# Altium project project.PrjPcb
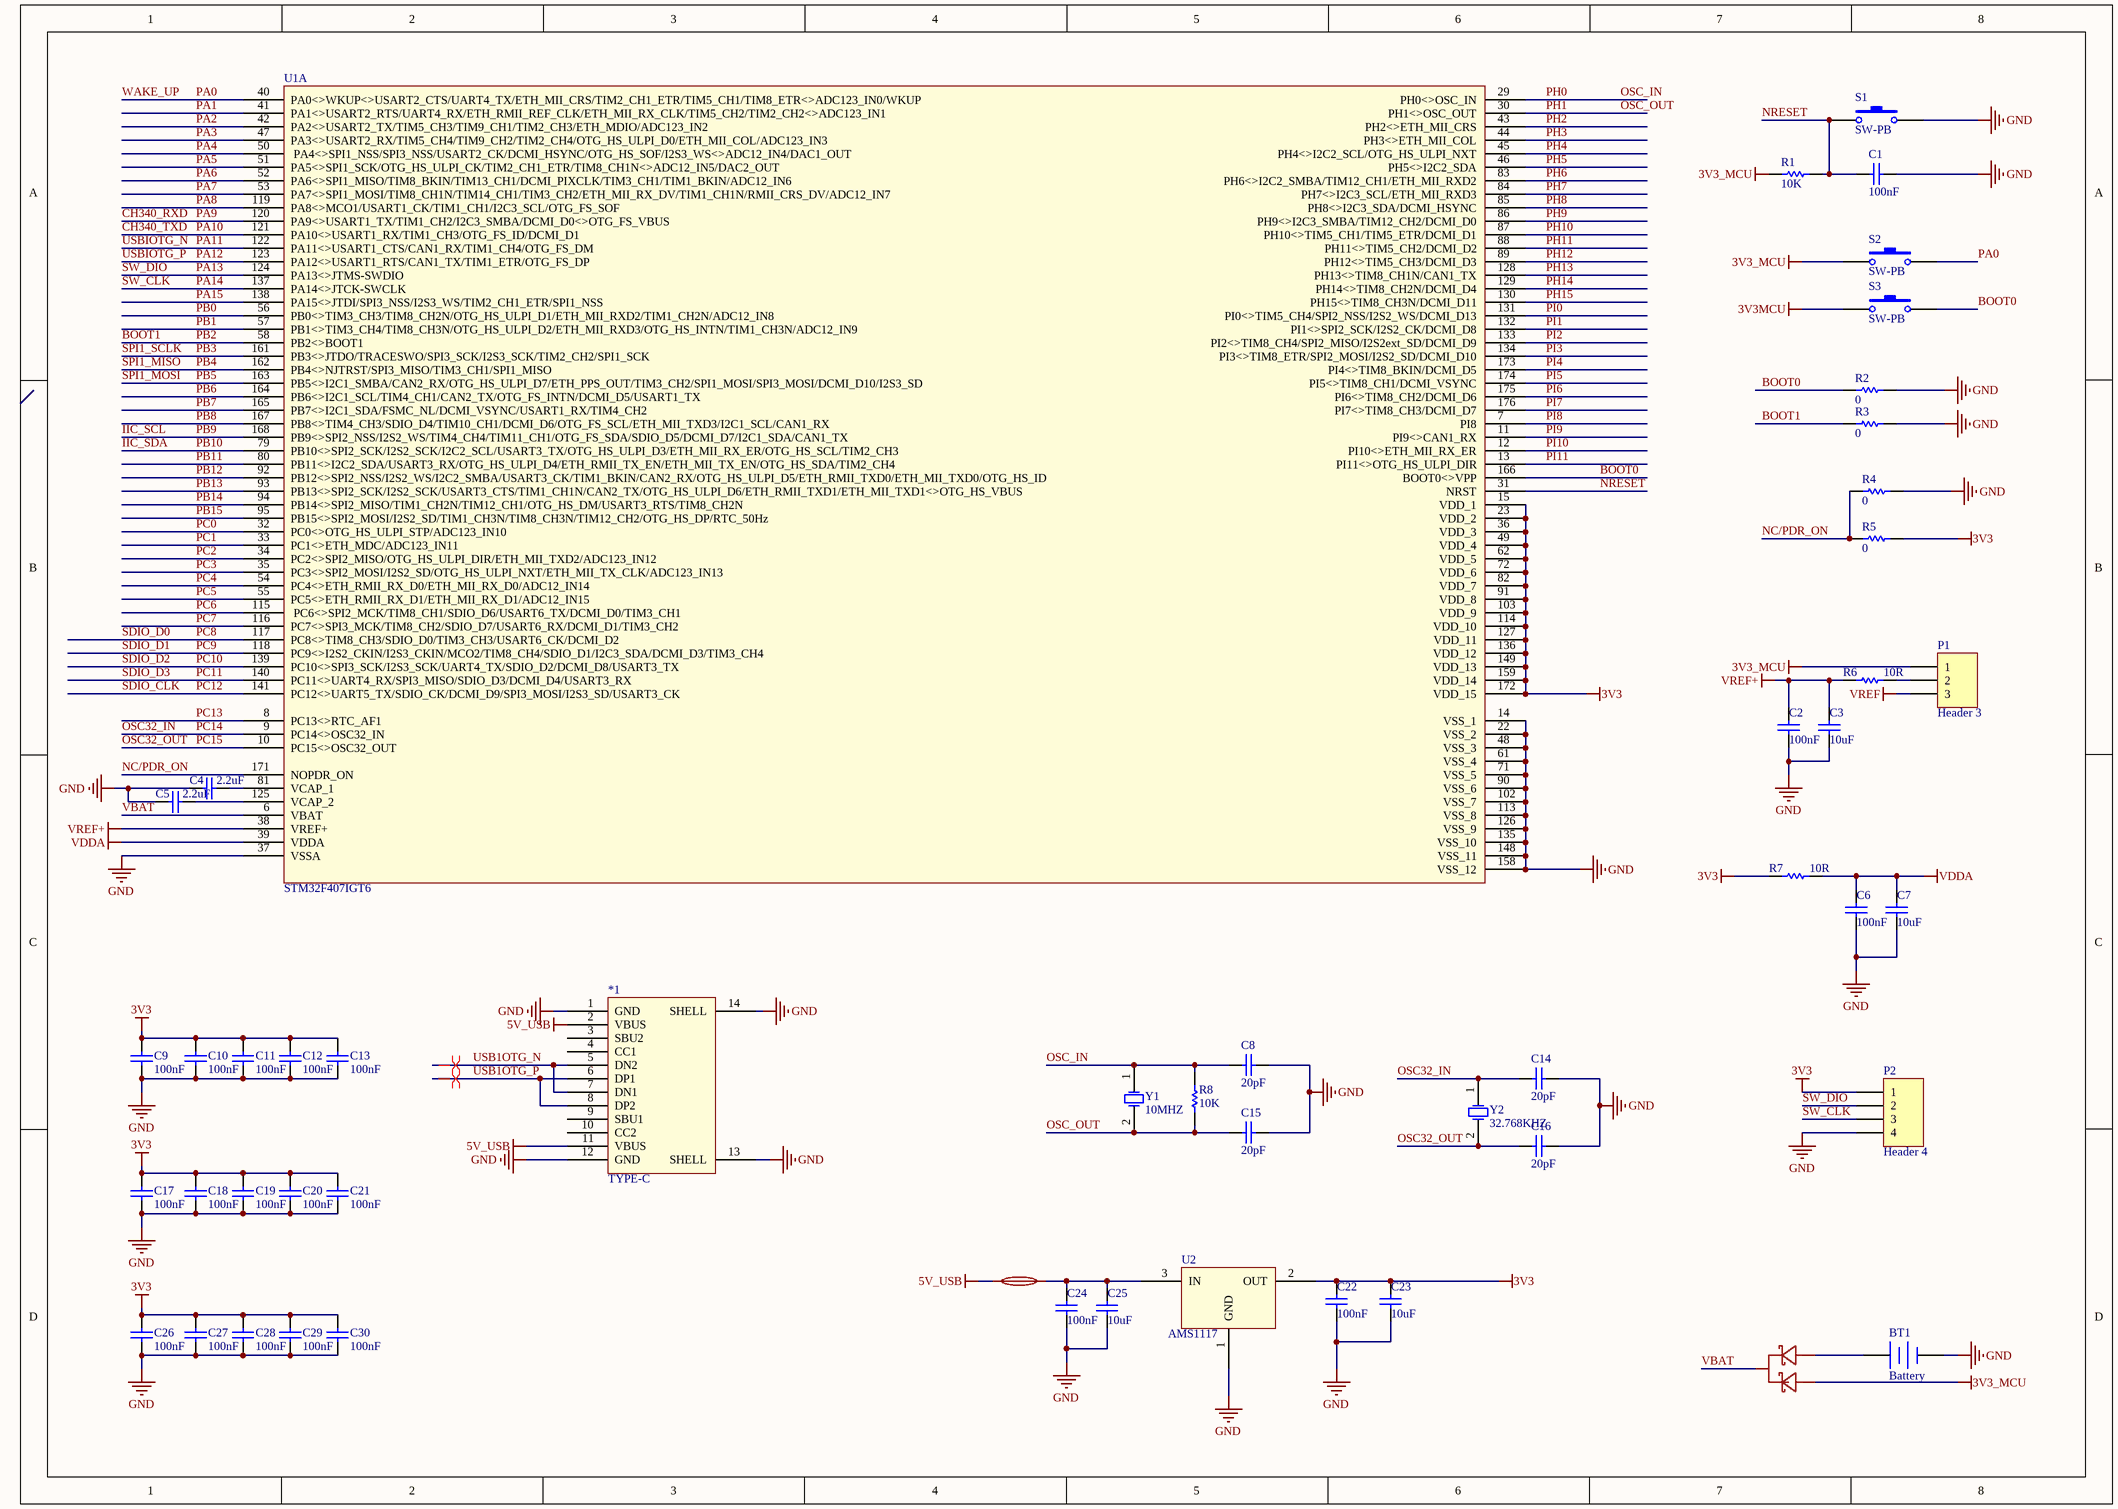
[diagram p0: Sheet2.SchDoc]
3 sheets, 96 parts. Net scope: global (net labels, ports and power ports of the same name join across sheets).
Board file: PCB1.PcbDoc
Sheets:
  Sheet2.SchDoc
  Sheet1.SchDoc
  Sheet3.SchDoc

## Sheet Sheet2.SchDoc
size A3; SheetNumber: 1; SheetTotal: 3

### Parts
*1  TYPE-C  [USB-C-SMD_TYPE-C-6PIN-2MD-073]
BT1  Battery  [BAT-SMD_CR1220-2]
C1  100nF  [C0603]
C2  100nF  [C0603]
C3  10uF  [C0603]
C4  2.2uF  [C0603]
C5  2.2uF  [C0603]
C6  100nF  [C0603]
C7  10uF  [C0603]
C8  20pF  [C0603]
C9  100nF  [C0603]
C10  100nF  [C0603]
C11  100nF  [C0603]
C12  100nF  [C0603]
C13  100nF  [C0603]
C14  20pF  [C0603]
C15  20pF  [C0603]
C16  20pF  [C0603]
C17  100nF  [C0603]
C18  100nF  [C0603]
C19  100nF  [C0603]
C20  100nF  [C0603]
C21  100nF  [C0603]
C22  100nF  [C0603]
C23  10uF  [C0603]
C24  100nF  [C0603]
C25  10uF  [C0603]
C26  100nF  [C0603]
C27  100nF  [C0603]
C28  100nF  [C0603]
C29  100nF  [C0603]
C30  100nF  [C0603]
F1  smd1206-100-30  [F1206]  (value not drawn)
P1  Header 3  [HDR1X3]
P2  Header 4  [CONN-SMD_HCZZ0021-4]
R1  10K  [R0603]
R2  0  [R0603]
R3  0  [R0603]
R4  0  [R0603]
R5  0  [R0603]
R6  10R  [R0603]
R7  10R  [R0603]
R8  10K  [R0603]
S1  SW-PB  [KEY-SMD_L6.2-W3.6-LS8.0]
S2  SW-PB  [KEY-SMD_L6.2-W3.6-LS8.0]
S3  SW-PB  [KEY-SMD_L6.2-W3.6-LS8.0]
U1  STM32F407IGT6  [LQFP-176_L24.0-W24.0-P0.50-BL]  (part A of 2)
U2  AMS1117  [SOT-89-3_L4.5-W2.5-P1.50-LS4.2-BR]
U3  bat54c_c22466350  [SOT-23-3_L2.9-W1.3-P1.90-LS2.4-BR]  (value not drawn)
Y1  10MHZ  [CRYSTAL-SMD_L5.0-W3.2]
Y2  32.768KHZ  [CRYSTAL-SMD_L5.0-W3.2]

### Nets
3V3: C9.1 C10.1 C11.1 C12.1 C13.1 C17.1 C18.1 C19.1 C20.1 C21.1 C22.1 C23.1 C26.1 C27.1 C28.1 C29.1 C30.1 P2.1 R5.1 R7.2 U1.15(VDD_1) U1.23(VDD_2) U1.36(VDD_3) U1.49(VDD_4) U1.62(VDD_5) U1.72(VDD_6) U1.82(VDD_7) U1.91(VDD_8) U1.103(VDD_9) U1.114(VDD_10) U1.127(VDD_11) U1.136(VDD_12) U1.149(VDD_13) U1.159(VDD_14) U1.172(VDD_15) U2.2(OUT)
3V3_MCU: P1.1 R1.2 S2.1 U3.1(A)
3V3MCU: S3.1
5V_USB: *1.2(VBUS) *1.11(VBUS) F1.1
GND: *1.1(GND) *1.12(GND) *1.13(SHELL) *1.14(SHELL) BT1.2(-) C1.2 C2.2 C3.2 C4.2 C5.1 C6.2 C7.2 C8.1 C9.2 C10.2 C11.2 C12.2 C13.2 C14.1 C15.1 C16.1 C17.2 C18.2 C19.2 C20.2 C21.2 C22.2 C23.2 C24.2 C25.2 C26.2 C27.2 C28.2 C29.2 C30.2 P2.4 R2.1 R3.1 R4.1 S1.2 U1.14(VSS_1) U1.22(VSS_2) U1.37(VSSA) U1.48(VSS_3) U1.61(VSS_4) U1.71(VSS_5) U1.90(VSS_6) U1.102(VSS_7) U1.113(VSS_8) U1.126(VSS_9) U1.135(VSS_10) U1.148(VSS_11) U1.158(VSS_12) U2.1(GND)
VDDA: C6.1 C7.1 R7.1 U1.39(VDDA)
VREF: P1.3
VREF+: C2.1 C3.1 R6.2 U1.38(VREF+)
BOOT0: R2.2 S3.2 U1.166(BOOT0<>VPP)
BOOT1: R3.2 U1.58(PB2<>BOOT1)  [also labelled PB2]
CH340_RXD: U1.120(PA9<>USART1_TX/TIM1_CH2/I2C3_SMBA/DCMI_D0<>OTG_FS_VBUS)  [also labelled PA9]
CH340_TXD: U1.121(PA10<>USART1_RX/TIM1_CH3/OTG_FS_ID/DCMI_D1)  [also labelled PA10]
IIC_SCL: U1.168(PB9<>SPI2_NSS/I2S2_WS/TIM4_CH4/TIM11_CH1/OTG_FS_SDA/SDIO_D5/DCMI_D7/I2C1_SDA/CAN1_TX)  [also labelled PB9]  [project net DCMI_SDA]
IIC_SDA: U1.79(PB10<>SPI2_SCK/I2S2_SCK/I2C2_SCL/USART3_TX/OTG_HS_ULPI_D3/ETH_MII_RX_ER/OTG_HS_SCL/TIM2_CH3)  [also labelled PB10]
NC/PDR_ON: R4.2 R5.2 U1.171(NOPDR_ON)
NRESET: C1.1 R1.1 S1.1 U1.31(NRST)
OSC32_IN: C14.2 U1.9(PC14<>OSC32_IN) Y2.1(OSC1)  [also labelled PC14]
OSC32_OUT: C16.2 U1.10(PC15<>OSC32_OUT) Y2.2(OSC2)  [also labelled PC15]
OSC_IN: C8.2 R8.1 U1.29(PH0<>OSC_IN) Y1.1(OSC1)  [also labelled PH0]
OSC_OUT: C15.2 R8.2 U1.30(PH1<>OSC_OUT) Y1.2(OSC2)  [also labelled PH1]
PA0: S2.2 U1.40(PA0<>WKUP<>USART2_CTS/UART4_TX/ETH_MII_CRS/TIM2_CH1_ETR/TIM5_CH1/TIM8_ETR<>ADC123_IN0/WKUP)  [also labelled WAKE_UP]
PA1: U1.41(PA1<>USART2_RTS/UART4_RX/ETH_RMII_REF_CLK/ETH_MII_RX_CLK/TIM5_CH2/TIM2_CH2<>ADC123_IN1)
PA2: U1.42(PA2<>USART2_TX/TIM5_CH3/TIM9_CH1/TIM2_CH3/ETH_MDIO/ADC123_IN2)
PA3: U1.47(PA3<>USART2_RX/TIM5_CH4/TIM9_CH2/TIM2_CH4/OTG_HS_ULPI_D0/ETH_MII_COL/ADC123_IN3)
PA4: U1.50(PA4<>SPI1_NSS/SPI3_NSS/USART2_CK/DCMI_HSYNC/OTG_HS_SOF/I2S3_WS<>ADC12_IN4/DAC1_OUT)  [project net DCMI_HREF]
PA5: U1.51(PA5<>SPI1_SCK/OTG_HS_ULPI_CK/TIM2_CH1_ETR/TIM8_CH1N<>ADC12_IN5/DAC2_OUT)
PA6: U1.52(PA6<>SPI1_MISO/TIM8_BKIN/TIM13_CH1/DCMI_PIXCLK/TIM3_CH1/TIM1_BKIN/ADC12_IN6)  [project net DCAM_PCLK]
PA7: U1.53(PA7<>SPI1_MOSI/TIM8_CH1N/TIM14_CH1/TIM3_CH2/ETH_MII_RX_DV/TIM1_CH1N/RMII_CRS_DV/ADC12_IN7)
PA8: U1.119(PA8<>MCO1/USART1_CK/TIM1_CH1/I2C3_SCL/OTG_FS_SOF)  [project net DCMI_XCLK]
PA11: U1.122(PA11<>USART1_CTS/CAN1_RX/TIM1_CH4/OTG_FS_DM)  [also labelled USBIOTG_N]
PA12: U1.123(PA12<>USART1_RTS/CAN1_TX/TIM1_ETR/OTG_FS_DP)  [also labelled USBIOTG_P]
PA13: P2.2 U1.124(PA13<>JTMS-SWDIO)  [also labelled SW_DIO]
PA14: P2.3 U1.137(PA14<>JTCK-SWCLK)  [also labelled SW_CLK]
PA15: U1.138(PA15<>JTDI/SPI3_NSS/I2S3_WS/TIM2_CH1_ETR/SPI1_NSS)
PB0: U1.56(PB0<>TIM3_CH3/TIM8_CH2N/OTG_HS_ULPI_D1/ETH_MII_RXD2/TIM1_CH2N/ADC12_IN8)
PB1: U1.57(PB1<>TIM3_CH4/TIM8_CH3N/OTG_HS_ULPI_D2/ETH_MII_RXD3/OTG_HS_INTN/TIM1_CH3N/ADC12_IN9)
PB3: U1.161(PB3<>JTDO/TRACESWO/SPI3_SCK/I2S3_SCK/TIM2_CH2/SPI1_SCK)  [also labelled SPI1_SCLK]
PB4: U1.162(PB4<>NJTRST/SPI3_MISO/TIM3_CH1/SPI1_MISO)  [also labelled SPI1_MISO]
PB5: U1.163(PB5<>I2C1_SMBA/CAN2_RX/OTG_HS_ULPI_D7/ETH_PPS_OUT/TIM3_CH2/SPI1_MOSI/SPI3_MOSI/DCMI_D10/I2S3_SD)  [also labelled SPI1_MOSI]  [project net DCMI_D5]
PB6: U1.164(PB6<>I2C1_SCL/TIM4_CH1/CAN2_TX/OTG_FS_INTN/DCMI_D5/USART1_TX)
PB7: U1.165(PB7<>I2C1_SDA/FSMC_NL/DCMI_VSYNC/USART1_RX/TIM4_CH2)  [project net DCAI_VSYNC]
PB8: U1.167(PB8<>TIM4_CH3/SDIO_D4/TIM10_CH1/DCMI_D6/OTG_FS_SCL/ETH_MII_TXD3/I2C1_SCL/CAN1_RX)  [project net DCMI_SCL]
PB11: U1.80(PB11<>I2C2_SDA/USART3_RX/OTG_HS_ULPI_D4/ETH_RMII_TX_EN/ETH_MII_TX_EN/OTG_HS_SDA/TIM2_CH4)
PB12: U1.92(PB12<>SPI2_NSS/I2S2_WS/I2C2_SMBA/USART3_CK/TIM1_BKIN/CAN2_RX/OTG_HS_ULPI_D5/ETH_RMII_TXD0/ETH_MII_TXD0/OTG_HS_ID)
PB13: U1.93(PB13<>SPI2_SCK/I2S2_SCK/USART3_CTS/TIM1_CH1N/CAN2_TX/OTG_HS_ULPI_D6/ETH_RMII_TXD1/ETH_MII_TXD1<>OTG_HS_VBUS)
PB14: U1.94(PB14<>SPI2_MISO/TIM1_CH2N/TIM12_CH1/OTG_HS_DM/USART3_RTS/TIM8_CH2N)
PB15: U1.95(PB15<>SPI2_MOSI/I2S2_SD/TIM1_CH3N/TIM8_CH3N/TIM12_CH2/OTG_HS_DP/RTC_50Hz)
PC0: U1.32(PC0<>OTG_HS_ULPI_STP/ADC123_IN10)  [project net DCMI_PWDN]
PC1: U1.33(PC1<>ETH_MDC/ADC123_IN11)
PC2: U1.34(PC2<>SPI2_MISO/OTG_HS_ULPI_DIR/ETH_MII_TXD2/ADC123_IN12)
PC3: U1.35(PC3<>SPI2_MOSI/I2S2_SD/OTG_HS_ULPI_NXT/ETH_MII_TX_CLK/ADC123_IN13)
PC4: U1.54(PC4<>ETH_RMII_RX_D0/ETH_MII_RX_D0/ADC12_IN14)
PC5: U1.55(PC5<>ETH_RMII_RX_D1/ETH_MII_RX_D1/ADC12_IN15)
PC6: U1.115(PC6<>SPI2_MCK/TIM8_CH1/SDIO_D6/USART6_TX/DCMI_D0/TIM3_CH1)  [project net DCMI_D0]
PC7: U1.116(PC7<>SPI3_MCK/TIM8_CH2/SDIO_D7/USART6_RX/DCMI_D1/TIM3_CH2)  [project net DCMI_D1]
PC8: U1.117(PC8<>TIM8_CH3/SDIO_D0/TIM3_CH3/USART6_CK/DCMI_D2)  [also labelled SDIO_D0]  [project net DCMI_D2]
PC9: U1.118(PC9<>I2S2_CKIN/I2S3_CKIN/MCO2/TIM8_CH4/SDIO_D1/I2C3_SDA/DCMI_D3/TIM3_CH4)  [also labelled SDIO_D1]  [project net DCMI_D3]
PC10: U1.139(PC10<>SPI3_SCK/I2S3_SCK/UART4_TX/SDIO_D2/DCMI_D8/USART3_TX)  [also labelled SDIO_D2]
PC11: U1.140(PC11<>UART4_RX/SPI3_MISO/SDIO_D3/DCMI_D4/USART3_RX)  [also labelled SDIO_D3]
PC12: U1.141(PC12<>UART5_TX/SDIO_CK/DCMI_D9/SPI3_MOSI/I2S3_SD/USART3_CK)  [also labelled SDIO_CLK]
PC13: U1.8(PC13<>RTC_AF1)
PH2: U1.43(PH2<>ETH_MII_CRS)
PH3: U1.44(PH3<>ETH_MII_COL)
PH4: U1.45(PH4<>I2C2_SCL/OTG_HS_ULPI_NXT)
PH5: U1.46(PH5<>I2C2_SDA)
PH6: U1.83(PH6<>I2C2_SMBA/TIM12_CH1/ETH_MII_RXD2)
PH7: U1.84(PH7<>I2C3_SCL/ETH_MII_RXD3)
PH8: U1.85(PH8<>I2C3_SDA/DCMI_HSYNC)
PH9: U1.86(PH9<>I2C3_SMBA/TIM12_CH2/DCMI_D0)
PH10: U1.87(PH10<>TIM5_CH1/TIM5_ETR/DCMI_D1)
PH11: U1.88(PH11<>TIM5_CH2/DCMI_D2)
PH12: U1.89(PH12<>TIM5_CH3/DCMI_D3)
PH13: U1.128(PH13<>TIM8_CH1N/CAN1_TX)
PH14: U1.129(PH14<>TIM8_CH2N/DCMI_D4)
PH15: U1.130(PH15<>TIM8_CH3N/DCMI_D11)
PI0: U1.131(PI0<>TIM5_CH4/SPI2_NSS/I2S2_WS/DCMI_D13)
PI1: U1.132(PI1<>SPI2_SCK/I2S2_CK/DCMI_D8)
PI2: U1.133(PI2<>TIM8_CH4/SPI2_MISO/I2S2ext_SD/DCMI_D9)
PI3: U1.134(PI3<>TIM8_ETR/SPI2_MOSI/I2S2_SD/DCMI_D10)
PI4: U1.173(PI4<>TIM8_BKIN/DCMI_D5)
PI5: U1.174(PI5<>TIM8_CH1/DCMI_VSYNC)
PI6: U1.175(PI6<>TIM8_CH2/DCMI_D6)
PI7: U1.176(PI7<>TIM8_CH3/DCMI_D7)
PI8: U1.7(PI8)
PI9: U1.11(PI9<>CAN1_RX)
PI10: U1.12(PI10<>ETH_MII_RX_ER)
PI11: U1.13(PI11<>OTG_HS_ULPI_DIR)
USB1OTG_N: *1.5(DN2) *1.7(DN1)
USB1OTG_P: *1.6(DP1) *1.8(DP2)
VBAT: U1.6(VBAT) U3.3(K)
NetBT1_1: BT1.1(+) U3.2(A)
NetC4_1: C4.1 U1.81(VCAP_1)
NetC5_2: C5.2 U1.125(VCAP_2)
NetC24_1: C24.1 C25.1 F1.2 U2.3(IN)
NetP1_2: P1.2 R6.1

Not connected (* = marked no-connect by the designer): *1 3(SBU2) 4(CC1) 9(SBU1) 10(CC2)

### Layout directives
differential pair: USB1OTG_N, USB1OTG_P

### Library data of the parts
BT1 = Battery: Multicell Battery; Published: 24-Mar-1999; LatestRevisionDate: 17-Jul-2002; LatestRevisionNote: Re-released for DXP Platform.; PackageReference: BAT-2; Publisher: Altium Limited; PackageDescription: Battery; 2 Leads
C1-C30 = Cap: Capacitor; Value: 100pF; Published: 8-Jun-2000; LatestRevisionDate: 17-Jul-2002; LatestRevisionNote: Re-released for DXP Platform.; PackageReference: RAD-0.3; Publisher: Altium Limited; PackageDescription: Radial Cap, Thru-Hole; 2 Leads; 0.3 in Pin Spacing
F1 = smd1206-100-30: 耐压(Vmax):30V;最大电流(Imax):40A;保持电流(Ihold):1A;跳闸电流(Itrip):1.8A;; Manufacturer: R+O(宏嘉诚); AddInBom: yes; ModelId: f1628daad26847a79b887277a2bc8541; ModelName: F1206_L3.2-W1.7-H0.6; ModelTransform: 125.984,66.929,0,0,0,0,0,0,0; Voltage - Max: 30V; Current - Max: 40A; Hold Current: 1A; Trip Current: 1.8A; Power Dissipation: 1W; Resistance - Initial (Ri) (Min): 50mΩ; Resistance - Post Trip (R1) (Max): 300mΩ; Time to Trip(Max): 300ms; Symbol: SMD1206-100-30; LCSC Part Name: 30V 1A; SupplierPart: C46641026; ManufacturerPart: SMD1206-100-30; Supplier Footprint: 1206; JLCPCB Part Class: Extended Part; Datasheet: https://item.szlcsc.com/datasheet/SMD1206-100-30/48798732.html; Supplier: LCSC; ConvertToPcb: yes; FootprintName: F1206; Operating Temperature: -40℃~+85℃; Length: 3.6mm; Width: 1.9mm; Height: 1.3mm
P1 = Header 3: Header, 3-Pin; LatestRevisionDate: 17-Jul-2002; LatestRevisionNote: Re-released for DXP Platform.; Publisher: Altium Limited
P2 = Header 4: Header, 4-Pin; LatestRevisionDate: 17-Jul-2002; LatestRevisionNote: Re-released for DXP Platform.; Publisher: Altium Limited
R1-R8 = Res1: Resistor; Value: 1K; Published: 8-Jun-2000; LatestRevisionDate: 17-Jul-2002; LatestRevisionNote: Re-released for DXP Platform.; PackageReference: AXIAL-0.3; Publisher: Altium Limited; PackageDescription: Axial Device, Thru-Hole; 2 Leads; 0.3 in Pin Spacing
S1-S3 = SW-PB: Switch; Published: 24-Mar-1999; LatestRevisionDate: 17-Jul-2002; LatestRevisionNote: Re-released for DXP Platform.; PackageReference: SPST-2; Publisher: Altium Limited; PackageDescription: Switch; 2 Leads
U1 = STM32F407IGT6: mcu
U3 = bat54c_c22466350: 二极管配置:1对共阴极;正向压降(Vf):1V@100mA;直流反向耐压(Vr):30V;整流电流:200mA;; Manufacturer: R+O(宏嘉诚); ManufacturerPart: BAT54C; AddInBom: yes; ModelId: 4be4999f02b344ffbcd0d3b39a4b0072; ModelName: SOT-23-3_L2.9-W1.3-P1.90-LS2.8-BR; ModelTransform: 110.236,114.173,0,0,0,0,0,0,0; Diode Configuration: 1对共阴极; Voltage - DC Reverse(Vr): 30V; Current - Rectified: 200mA; Reverse Leakage Current (Ir): 2uA@25V; Non-Repetitive Peak Forward Surge Current: 600mA; Symbol: BAT54C_C22466350; LCSC Part Name: 电压:30V 电流:0.2A; SupplierPart: C22466350; Supplier Footprint: SOT-23; JLCPCB Part Class: Extended Part; Datasheet: https://item.szlcsc.com/datasheet/BAT54C/24165509.html; Supplier: LCSC; ConvertToPcb: yes; FootprintName: SOT-23-3_L2.9-W1.3-P1.90-LS2.8-BR; Voltage - Forward(Vf@If): 1V@100mA; Operating Junction Temperature Range: -
Y1 Y2 = XTAL: Crystal Oscillator; Published: 8-Jun-2000; LatestRevisionDate: 17-Jul-2002; LatestRevisionNote: Re-released for DXP Platform.; PackageReference: R38; Publisher: Altium Limited; PackageDescription: Crystal, Thru-Hole; 2 Leads; Body 3.1 x 8.2 mm (Dia.xH)

## Sheet Sheet1.SchDoc
size A3; SheetNumber: 2; SheetTotal: 3
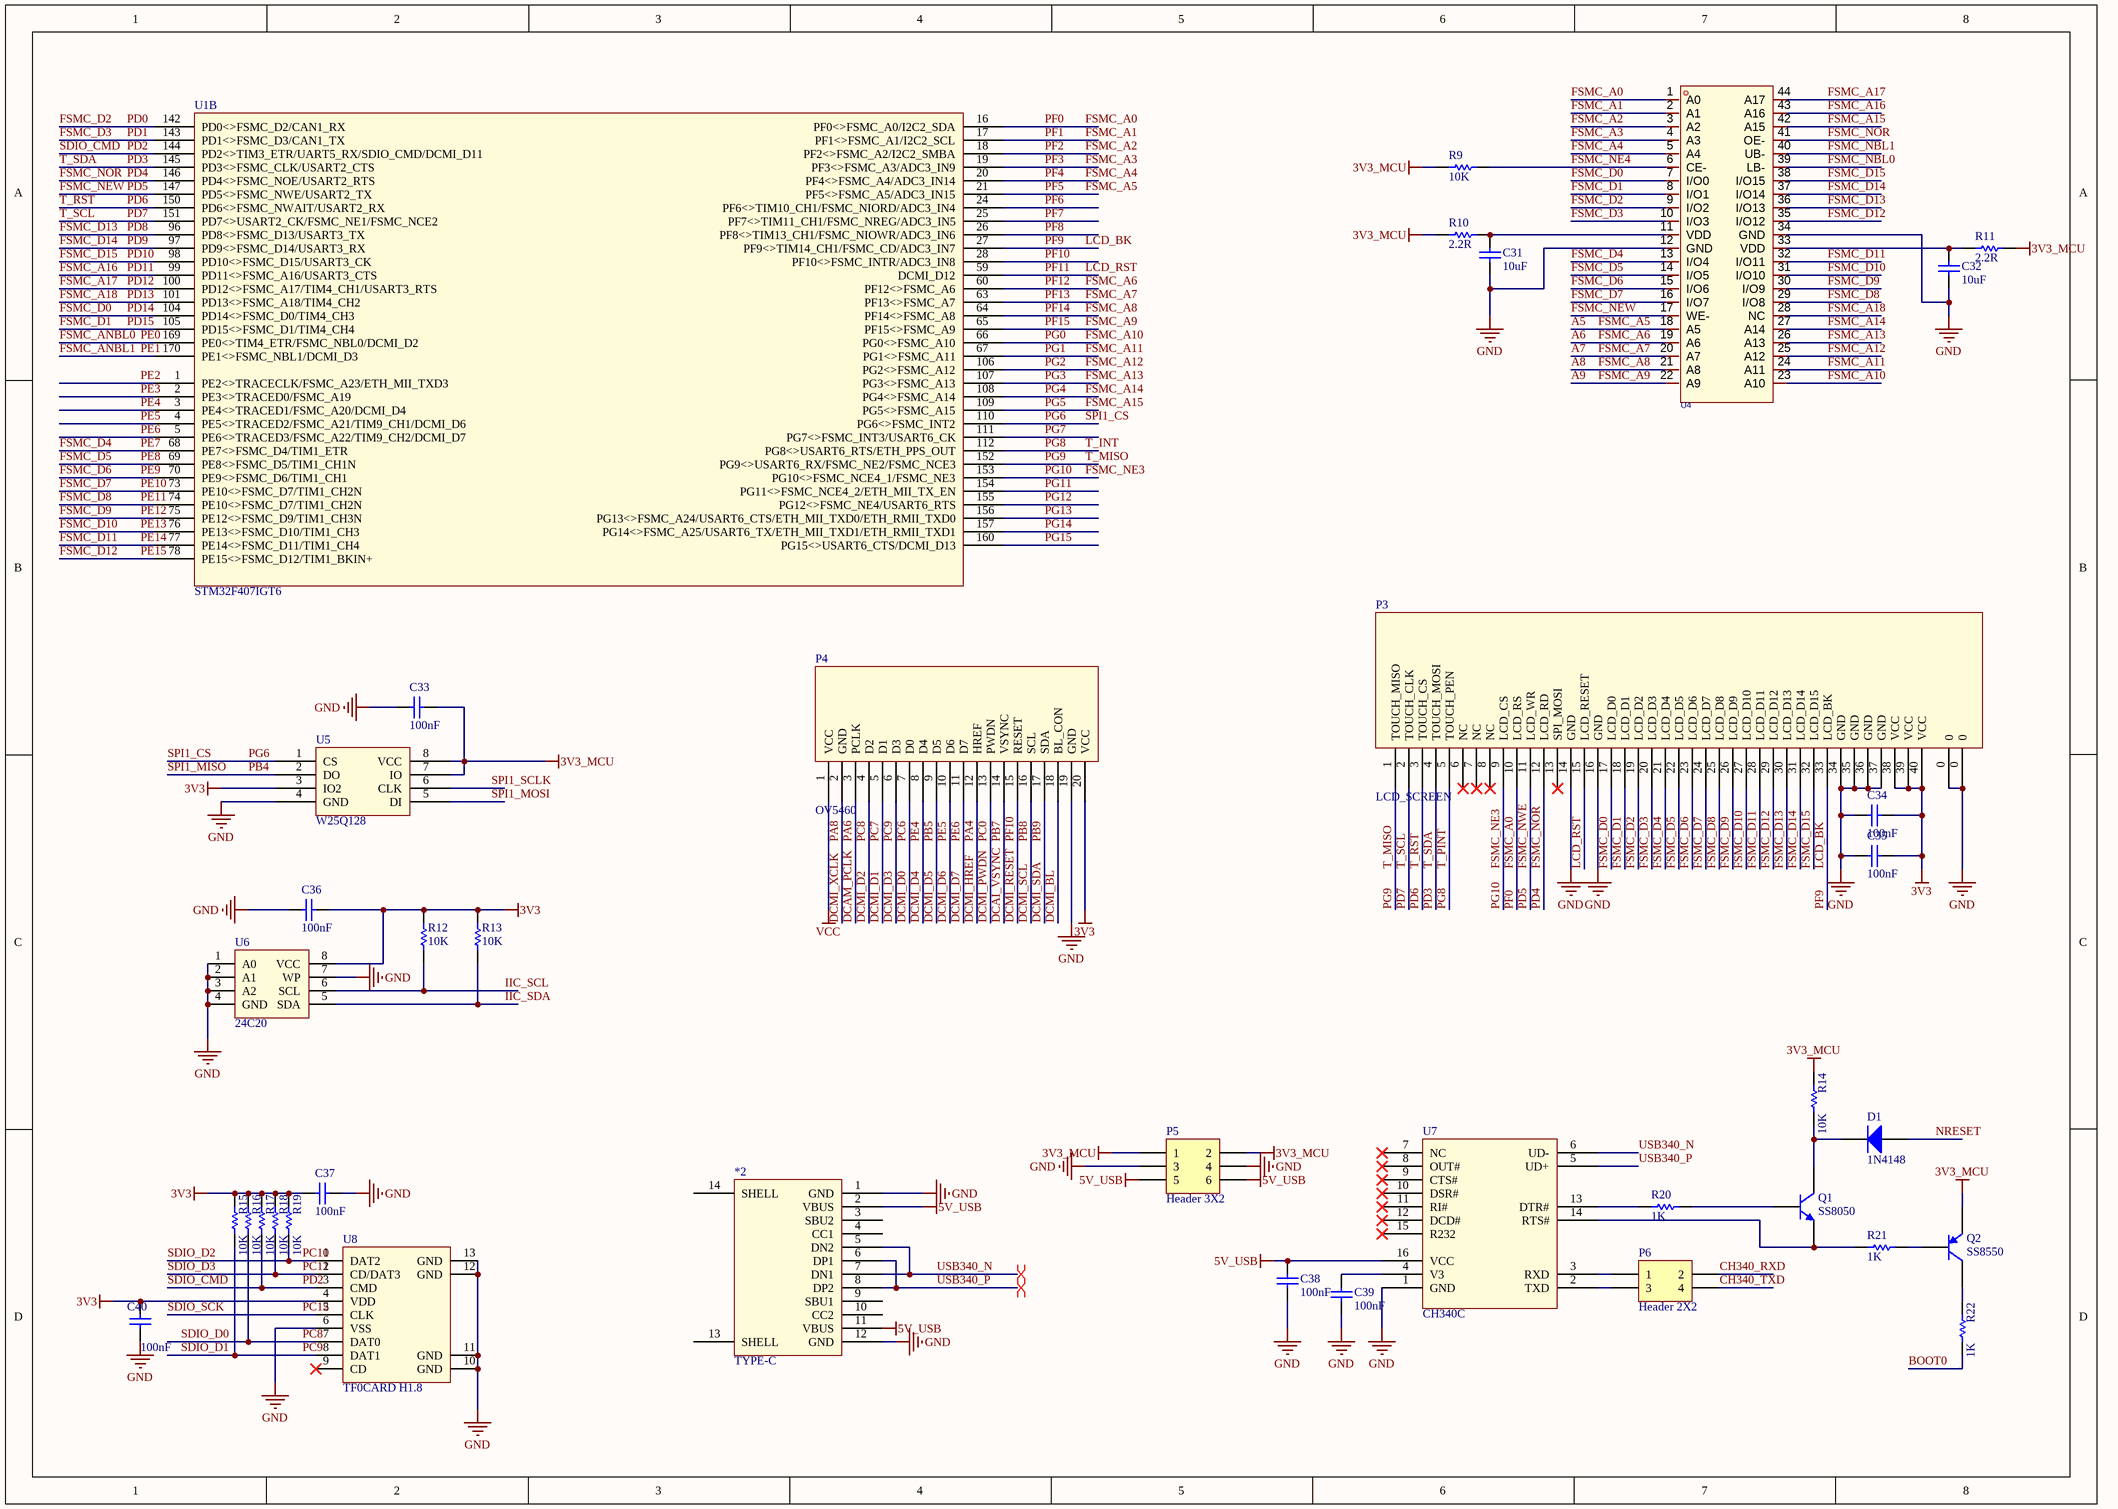
[diagram p1: Sheet1.SchDoc]

### Parts
*2  TYPE-C  [USB-C-SMD_TYPE-C-6PIN-2MD-073]
C31  10uF  [C0603]
C32  10uF  [C0603]
C33  100nF  [C0603]
C34  100nF  [C0603]
C35  100nF  [C0603]
C36  100nF  [C0603]
C37  100nF  [C0603]
C38  100nF  [C0603]
C39  100nF  [C0603]
C40  100nF  [C0603]
D1  1N4148  [SOD-123_L2.7-W1.6-LS3.7-FD]
P3  LCD_SCREEN  [FPC-SMD_P0.50-40P_FGS-XJ-H2.0]
P4  OV5460  [FPC-SMD_20P-P0.50_XUNPU_FPC-05F-20PH20]
P5  Header 3X2  [HDR2X3]
P6  Header 2X2  [HDR2X2]
Q1  SS8050  [SOT-23-3_L2.9-W1.3-P1.90-LS2.4-BR]
Q2  SS8550  [SOT-23-3_L2.9-W1.3-P1.90-LS2.4-BR]
R9  10K  [R0603]
R10  2.2R  [R0603]
R11  2.2R  [R0603]
R12  10K  [R0603]
R13  10K  [R0603]
R14  10K  [R0603]
R15  10K  [R0603]
R16  10K  [R0603]
R17  10K  [R0603]
R18  10K  [R0603]
R19  10K  [R0603]
R20  1K  [R0603]
R21  1K  [R0603]
R22  1K  [R0603]
U1  STM32F407IGT6  [LQFP-176_L24.0-W24.0-P0.50-BL]  (part B of 2)
U4  is61lv25616al-10tli-tr  [TSOP-44_L18.4-W10.2-P0.80-LS11.8-BL]  (value not drawn)
U5  W25Q128  [SOIC-8_L5.3-W5.3-P1.27-LS8.0-BL]
U6  24C20  [SOP-8_L5.0-W4.0-P1.27-LS6.0-BL]
U7  CH340C  [SOP-16_L10.0-W3.9-P1.27-LS6.0-BL]
U8  TF0CARD H1.8  [TF-SMD_TF-PUSH]

### Nets
3V3: C34.2 C35.2 C36.1 C37.2 C40.1 P3.38(VCC) P3.39(VCC) P3.40(VCC) P4.20(VCC) R12.2 R13.2 R15.2 R16.2 R17.2 R18.2 R19.2 U5.3(IO2) U6.8(VCC) U8.4(VDD)
3V3_MCU: C33.1 P5.1 P5.2 Q2.3(E) R9.1 R10.1 R11.2 R14.2 U5.7(IO) U5.8(VCC)
5V_USB: *2.2(VBUS) *2.11(VBUS) C38.2 P5.5 P5.6 U7.16(VCC)
GND: *2.1(GND) *2.12(GND) C31.1 C32.1 C33.2 C34.1 C35.1 C36.2 C37.1 C38.1 C39.1 C40.2 P3.0 P3.14(GND) P3.16(GND) P3.34(GND) P3.35(GND) P3.36(GND) P3.37(GND) P4.19(GND) P5.3 P5.4 U4.12(GND) U4.34(GND) U5.4(GND) U6.1(A0) U6.2(A1) U6.3(A2) U6.4(GND) U6.7(WP) U7.1(GND) U8.6(VSS) U8.10(GND) U8.11(GND) U8.12(GND) U8.13(GND)
VCC: P4.1(VCC)
A5: U1.21(PF5<>FSMC_A5/ADC3_IN15) U4.18(A5)  [also labelled FSMC_A5, PF5]
A6: U1.60(PF12<>FSMC_A6) U4.19(A6)  [also labelled FSMC_A6, PF12]
A7: U1.63(PF13<>FSMC_A7) U4.20(A7)  [also labelled FSMC_A7, PF13]
A8: U1.64(PF14<>FSMC_A8) U4.21(A8)  [also labelled FSMC_A8, PF14]
A9: U1.65(PF15<>FSMC_A9) U4.22(A9)  [also labelled FSMC_A9, PF15]
BOOT0: R22.1
CH340_RXD: P6.2
CH340_TXD: P6.4
DCAI_VSYNC: P4.14(VSYNC)  [also labelled PB7]
DCAM_PCLK: P4.3(PCLK)  [also labelled PA6]
DCMI_BL: P4.18(BL_CON)
DCMI_D0: P4.7(D0)  [also labelled PC6]
DCMI_D1: P4.5(D1)  [also labelled PC7]
DCMI_D2: P4.4(D2) R16.1 U8.7(DAT0)  [also labelled PC8, SDIO_D0]
DCMI_D3: P4.6(D3) R15.1 U8.8(DAT1)  [also labelled PC9, SDIO_D1]
DCMI_D4: P4.8(D4) U1.3(PE4<>TRACED1/FSMC_A20/DCMI_D4)  [also labelled PE4]
DCMI_D5: P4.9(D5) U5.5(DI)  [also labelled PB5, SPI1_MOSI]
DCMI_D6: P4.10(D6) U1.4(PE5<>TRACED2/FSMC_A21/TIM9_CH1/DCMI_D6)  [also labelled PE5]
DCMI_D7: P4.11(D7) U1.5(PE6<>TRACED3/FSMC_A22/TIM9_CH2/DCMI_D7)  [also labelled PE6]
DCMI_HREF: P4.12(HREF)  [also labelled PA4]
DCMI_PWDN: P4.13(PWDN)  [also labelled PC0]
DCMI_RESET: P4.15(RESET) U1.28(PF10<>FSMC_INTR/ADC3_IN8)  [also labelled PF10]
DCMI_SCL: P4.16(SCL)  [also labelled PB8]
DCMI_SDA: P4.17(SDA) R12.1 U6.6(SCL)  [also labelled IIC_SCL, PB9]
DCMI_XCLK: P4.2(GND)  [also labelled PA8]
FSMC_A0: P3.10(LCD_RS) U1.16(PF0<>FSMC_A0/I2C2_SDA) U4.1(A0)  [also labelled PF0]
FSMC_A1: U1.17(PF1<>FSMC_A1/I2C2_SCL) U4.2(A1)  [also labelled PF1]
FSMC_A2: U1.18(PF2<>FSMC_A2/I2C2_SMBA) U4.3(A2)  [also labelled PF2]
FSMC_A3: U1.19(PF3<>FSMC_A3/ADC3_IN9) U4.4(A3)  [also labelled PF3]
FSMC_A4: U1.20(PF4<>FSMC_A4/ADC3_IN14) U4.5(A4)  [also labelled PF4]
FSMC_A10: U1.66(PG0<>FSMC_A10) U4.23(A10)  [also labelled PG0]
FSMC_A11: U1.67(PG1<>FSMC_A11) U4.24(A11)  [also labelled PG1]
FSMC_A12: U1.106(PG2<>FSMC_A12) U4.25(A12)  [also labelled PG2]
FSMC_A13: U1.107(PG3<>FSMC_A13) U4.26(A13)  [also labelled PG3]
FSMC_A14: U1.108(PG4<>FSMC_A14) U4.27(A14)  [also labelled PG4]
FSMC_A15: U1.109(PG5<>FSMC_A15) U4.42(A15)  [also labelled PG5]
FSMC_A16: U1.99(PD11<>FSMC_A16/USART3_CTS) U4.43(A16)  [also labelled PD11]
FSMC_A17: U1.100(PD12<>FSMC_A17/TIM4_CH1/USART3_RTS) U4.44(A17)  [also labelled PD12]
FSMC_A18: U1.101(PD13<>FSMC_A18/TIM4_CH2) U4.28(NC)  [also labelled PD13]
FSMC_ANBL0: U1.169(PE0<>TIM4_ETR/FSMC_NBL0/DCMI_D2)  [also labelled PE0]
FSMC_ANBL1: U1.170(PE1<>FSMC_NBL1/DCMI_D3)  [also labelled PE1]
FSMC_D0: P3.17(LCD_D0) U1.104(PD14<>FSMC_D0/TIM4_CH3) U4.7(I/O0)  [also labelled PD14]
FSMC_D1: P3.18(LCD_D1) U1.105(PD15<>FSMC_D1/TIM4_CH4) U4.8(I/O1)  [also labelled PD15]
FSMC_D2: P3.19(LCD_D2) U1.142(PD0<>FSMC_D2/CAN1_RX) U4.9(I/O2)  [also labelled PD0]
FSMC_D3: P3.20(LCD_D3) U1.143(PD1<>FSMC_D3/CAN1_TX) U4.10(I/O3)  [also labelled PD1]
FSMC_D4: P3.21(LCD_D4) U1.68(PE7<>FSMC_D4/TIM1_ETR) U4.13(I/O4)  [also labelled PE7]
FSMC_D5: P3.22(LCD_D5) U1.69(PE8<>FSMC_D5/TIM1_CH1N) U4.14(I/O5)  [also labelled PE8]
FSMC_D6: P3.23(LCD_D6) U1.70(PE9<>FSMC_D6/TIM1_CH1) U4.15(I/O6)  [also labelled PE9]
FSMC_D7: P3.24(LCD_D7) U1.73(PE10<>FSMC_D7/TIM1_CH2N) U4.16(I/O7)  [also labelled PE10]
FSMC_D8: P3.25(LCD_D8) U1.74(PE10<>FSMC_D7/TIM1_CH2N) U4.29(I/O8)  [also labelled PE11]
FSMC_D9: P3.26(LCD_D9) U1.75(PE12<>FSMC_D9/TIM1_CH3N) U4.30(I/O9)  [also labelled PE12]
FSMC_D10: P3.27(LCD_D10) U1.76(PE13<>FSMC_D10/TIM1_CH3) U4.31(I/O10)  [also labelled PE13]
FSMC_D11: P3.28(LCD_D11) U1.77(PE14<>FSMC_D11/TIM1_CH4) U4.32(I/O11)  [also labelled PE14]
FSMC_D12: P3.29(LCD_D12) U1.78(PE15<>FSMC_D12/TIM1_BKIN+) U4.35(I/O12)  [also labelled PE15]
FSMC_D13: P3.30(LCD_D13) U1.96(PD8<>FSMC_D13/USART3_TX) U4.36(I/O13)  [also labelled PD8]
FSMC_D14: P3.31(LCD_D14) U1.97(PD9<>FSMC_D14/USART3_RX) U4.37(I/O14)  [also labelled PD9]
FSMC_D15: P3.32(LCD_D15) U1.98(PD10<>FSMC_D15/USART3_CK) U4.38(I/O15)  [also labelled PD10]
FSMC_NBL0: U4.39(LB-)
FSMC_NBL1: U4.40(UB-)
FSMC_NE3: P3.9(LCD_CS) U1.153(PG10<>FSMC_NCE4_1/FSMC_NE3)  [also labelled PG10]
FSMC_NE4: R9.2 U4.6(CE-)
FSMC_NEW: P3.11(LCD_WR) U1.147(PD5<>FSMC_NWE/USART2_TX) U4.17(WE-)  [also labelled FSMC_NWE, PD5]
FSMC_NOR: P3.12(LCD_RD) U1.146(PD4<>FSMC_NOE/USART2_RTS) U4.41(OE-)  [also labelled PD4]
IIC_SDA: R13.1 U6.5(SDA)
LCD_BK: P3.33(LCD_BK) U1.27(PF9<>TIM14_CH1/FSMC_CD/ADC3_IN7)  [also labelled PF9]
LCD_RST: P3.15(LCD_RESET) U1.59(DCMI_D12)  [also labelled PF11]
NRESET: D1.1(A)
PB4: U5.2(DO)  [also labelled SPI1_MISO]
PC10: R19.1 U8.1(DAT2)  [also labelled SDIO_D2]
PC11: R18.1 U8.2(CD/DAT3)  [also labelled SDIO_D3]
PC12: U8.5(CLK)  [also labelled SDIO_SCK]
PD2: R17.1 U1.144(PD2<>TIM3_ETR/UART5_RX/SDIO_CMD/DCMI_D11) U8.3(CMD)  [also labelled SDIO_CMD]
PD3: P3.4(TOUCH_MOSI) U1.145(PD3<>FSMC_CLK/USART2_CTS)  [also labelled T_SDA, T_SD~{A}]
PD6: P3.3(TOUCH_CS) U1.150(PD6<>FSMC_NWAIT/USART2_RX)  [also labelled T_RST]
PD7: P3.2(TOUCH_CLK) U1.151(PD7<>USART2_CK/FSMC_NE1/FSMC_NCE2)  [also labelled T_SCL]
PE2: U1.1(PE2<>TRACECLK/FSMC_A23/ETH_MII_TXD3)
PE3: U1.2(PE3<>TRACED0/FSMC_A19)
PF6: U1.24(PF6<>TIM10_CH1/FSMC_NIORD/ADC3_IN4)
PF7: U1.25(PF7<>TIM11_CH1/FSMC_NREG/ADC3_IN5)
PF8: U1.26(PF8<>TIM13_CH1/FSMC_NIOWR/ADC3_IN6)
PG6: U1.110(PG6<>FSMC_INT2) U5.1(CS)  [also labelled SPI1_CS]
PG7: U1.111(PG7<>FSMC_INT3/USART6_CK)
PG8: P3.5(TOUCH_PEN) U1.112(PG8<>USART6_RTS/ETH_PPS_OUT)  [also labelled T_INT, T_PINT]
PG9: P3.1(TOUCH_MISO) U1.152(PG9<>USART6_RX/FSMC_NE2/FSMC_NCE3)  [also labelled T_MISO]
PG11: U1.154(PG11<>FSMC_NCE4_2/ETH_MII_TX_EN)
PG12: U1.155(PG12<>FSMC_NE4/USART6_RTS)
PG13: U1.156(PG13<>FSMC_A24/USART6_CTS/ETH_MII_TXD0/ETH_RMII_TXD0)
PG14: U1.157(PG14<>FSMC_A25/USART6_TX/ETH_MII_TXD1/ETH_RMII_TXD1)
PG15: U1.160(PG15<>USART6_CTS/DCMI_D13)
SPI1_SCLK: U5.6(CLK)  [project net PB3]
USB340_N: *2.5(DN2) *2.7(DN1) U7.6(UD-)
USB340_P: *2.6(DP1) *2.8(DP2) U7.5(UD+)
NetC31_2: C31.2 R10.2 U4.11(VDD)
NetC32_2: C32.2 R11.1 U4.33(VDD)
NetC39_2: C39.2 U7.4(V3)
NetD1_2: D1.2(K) Q1.1(C) R14.1
NetP6_1: P6.1 U7.3(RXD)
NetP6_3: P6.3 U7.2(TXD)
NetQ1_2: Q1.2(B) R20.1
NetQ1_3: Q1.3(E) R21.2 U7.14(RTS#)
NetQ2_1: Q2.1(C) R22.2
NetQ2_2: Q2.2(B) R21.1
NetR20_2: R20.2 U7.13(DTR#)

Not connected (* = marked no-connect by the designer): *2 3(SBU2) 4(CC1) 9(SBU1) 10(CC2) 13(SHELL) 14(SHELL); P3 6(NC)* 7(NC)* 8(NC)* 13(SPI_MOSI)*; U7 7(NC)* 8(OUT#)* 9(CTS#)* 10(DSR#)* 11(RI#)* 12(DCD#)* 15(R232)*; U8 9(CD)*

### Layout directives
differential pair: USB340_N, USB340_P

### Library data of the parts
C31-C40 = Cap: Capacitor; Value: 100pF; Published: 8-Jun-2000; LatestRevisionDate: 17-Jul-2002; LatestRevisionNote: Re-released for DXP Platform.; PackageReference: RAD-0.3; Publisher: Altium Limited; PackageDescription: Radial Cap, Thru-Hole; 2 Leads; 0.3 in Pin Spacing
D1 = Diode 1N4148: High Conductance Fast Diode; Published: 8-Jun-2000; LatestRevisionDate: 17-Jul-2002; LatestRevisionNote: Re-released for DXP Platform.; DatasheetVersion: 1997; PackageReference: DO-35; Publisher: Altium Limited; PackageDescription: Diode, Axial; Body 3.8 x 1.9 mm (LxDia. max), Lead Dia. 0.53 mm (max); Code_JEDEC: DO-204-AH; ComponentLink1Description: Manufacturer Link; ComponentLink1URL: http://www.fairchildsemi.com/; ComponentLink2Description: Datasheet; ComponentLink2URL: http://www.fairchildsemi.com/ds/1N%2F1N4148.pdf
P5 = Header 3X2: Header, 3-Pin, Dual row; LatestRevisionDate: 17-Jul-2002; LatestRevisionNote: Re-released for DXP Platform.; Publisher: Altium Limited
P6 = Header 2X2: Header, 2-Pin, Dual row; LatestRevisionDate: 17-Jul-2002; LatestRevisionNote: Re-released for DXP Platform.; Publisher: Altium Limited
Q1 = NPN: NPN Bipolar Transistor; Published: 8-Jun-2000; LatestRevisionDate: 17-Jul-2002; LatestRevisionNote: Re-released for DXP Platform.; PackageReference: TO-226-AA; Publisher: Altium Limited; PackageDescription: TO, Flat Index; 3 In-Line, Axial Leads; Body Dia. 4.8mm; Leads 0.55 x 0.51 mm (max); Code_JEDEC: TO-226-AA
Q2 = PNP: PNP Bipolar Transistor; Published: 8-Jun-2000; LatestRevisionDate: 29-May-2009; LatestRevisionNote: IPC-7351 Footprint Added.; PackageVersion: Aug-1999; PackageReference: SOT-23B; Publisher: Altium Limited; PackageDescription: 3-Pin SOT-23 Package 0.95 mm Pitch, 2.4 mm Lead Span
R9-R19 = Res1: Resistor; Value: 1K; Published: 8-Jun-2000; LatestRevisionDate: 17-Jul-2002; LatestRevisionNote: Re-released for DXP Platform.; PackageReference: AXIAL-0.3; Publisher: Altium Limited; PackageDescription: Axial Device, Thru-Hole; 2 Leads; 0.3 in Pin Spacing
R20-R22 = Res1: Resistor; Published: 8-Jun-2000; LatestRevisionDate: 17-Jul-2002; LatestRevisionNote: Re-released for DXP Platform.; PackageReference: AXIAL-0.3; Publisher: Altium Limited; PackageDescription: Axial Device, Thru-Hole; 2 Leads; 0.3 in Pin Spacing; Value: 1K
U1 = STM32F407IGT6: mcu
U4 = is61lv25616al-10tli-tr: 存储容量:4Mbit;工作电压:3.3V~3.63V;; Manufacturer: ISSI(北京矽成); AddInBom: yes; ModelId: 560eb33016ce4e308706c564a2ec9c3c; ModelName: TSOP-44_L18.4-W10.2-H1.0-LS11.8-P0.80; ModelTransform: 465.06033,724.408,0,90,0,0,0,-0.0005,0; Interface: 并口(Parallel); Memory Size: 4Mbit; Access Time: 10ns; Supply Current (Icc): 110mA; Standby Current (Iq): 20mA; LCSC Part Name: IS61LV25616AL 10TLI TR; SupplierPart: C2063046; ManufacturerPart: IS61LV25616AL-10TLI-TR; Supplier Footprint: TSOPII-44-10.2mm; JLCPCB Part Class: Extended Part; Datasheet: https://item.szlcsc.com/datasheet/IS61LV25616AL-10TLI-TR/2154619.html; Supplier: LCSC; ConvertToPcb: yes; SymbolName: IS61LV25616AL-10TLI-TR; FootprintName: TSOP-44_L18.4-W10.2-P0.80-LS11.8-BL; Voltage - Supply: 3.3V~3.63V; Operating Temperature: -40℃~+85℃; Features: 自动掉电功能
U6 = 24C20: EEPROM

## Sheet Sheet3.SchDoc
size A4; SheetNumber: 3; SheetTotal: 3
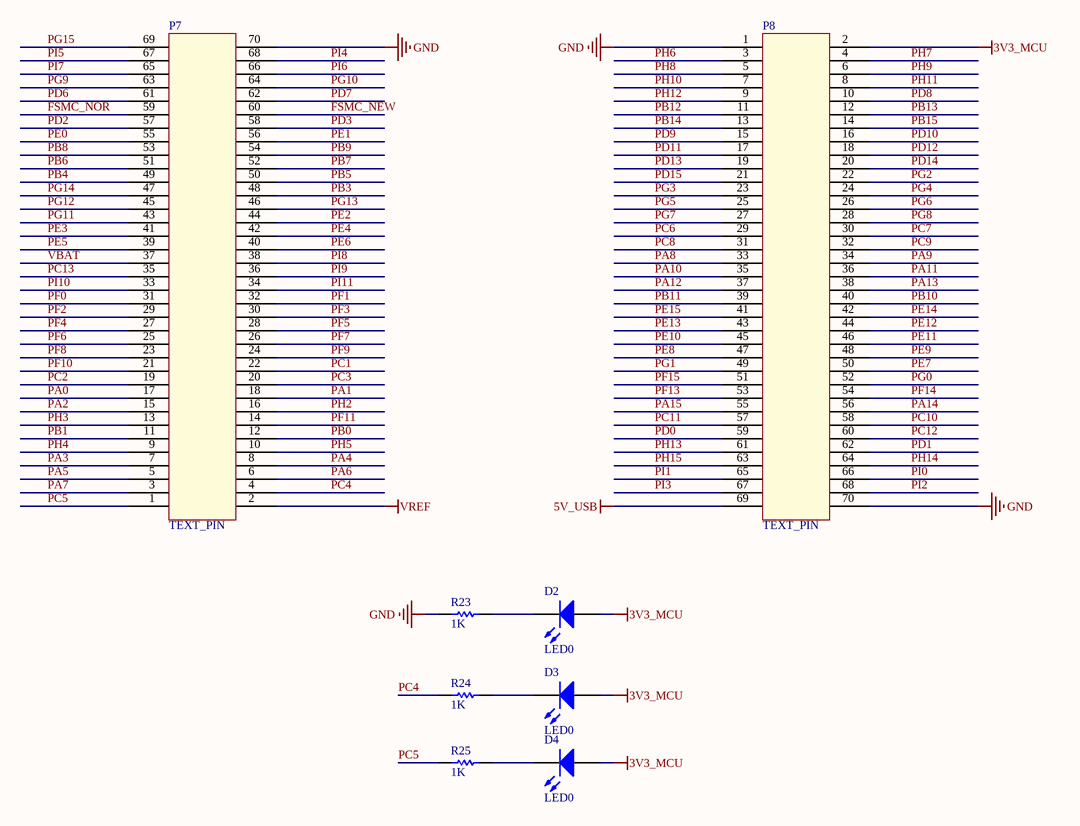
[diagram p2: Sheet3.SchDoc]

### Parts
D2  LED0  [LED0603-RD_RED]
D3  LED0  [LED0603-RD_RED]
D4  LED0  [LED0603-RD_RED]
P7  TEXT_PIN  [TEST_P70]
P8  TEXT_PIN  [TEST_P70]
R23  1K  [R0603]
R24  1K  [R0603]
R25  1K  [R0603]

### Nets
3V3_MCU: D2.1(A) D3.1(A) D4.1(A) P8.2
5V_USB: P8.69
GND: P7.70 P8.1 P8.70 R23.2
VREF: P7.2
FSMC_NEW: P7.60
FSMC_NOR: P7.59
PA0: P7.17
PA1: P7.18
PA2: P7.15
PA3: P7.7
PA4: P7.8  [project net DCMI_HREF]
PA5: P7.5
PA6: P7.6  [project net DCAM_PCLK]
PA7: P7.3
PA8: P8.33  [project net DCMI_XCLK]
PA9: P8.34  [project net CH340_RXD]
PA10: P8.35  [project net CH340_TXD]
PA11: P8.36
PA12: P8.37
PA13: P8.38
PA14: P8.56
PA15: P8.55
PB0: P7.12
PB1: P7.11
PB3: P7.48
PB4: P7.49
PB5: P7.50  [project net DCMI_D5]
PB6: P7.51
PB7: P7.52  [project net DCAI_VSYNC]
PB8: P7.53  [project net DCMI_SCL]
PB9: P7.54  [project net DCMI_SDA]
PB10: P8.40  [project net IIC_SDA]
PB11: P8.39
PB12: P8.11
PB13: P8.12
PB14: P8.13
PB15: P8.14
PC1: P7.22
PC2: P7.19
PC3: P7.20
PC4: P7.4 R24.2
PC5: P7.1 R25.2
PC6: P8.29  [project net DCMI_D0]
PC7: P8.30  [project net DCMI_D1]
PC8: P8.31  [project net DCMI_D2]
PC9: P8.32  [project net DCMI_D3]
PC10: P8.58
PC11: P8.57
PC12: P8.60
PC13: P7.35
PD0: P8.59  [project net FSMC_D2]
PD1: P8.62  [project net FSMC_D3]
PD2: P7.57
PD3: P7.58
PD6: P7.61
PD7: P7.62
PD8: P8.10  [project net FSMC_D13]
PD9: P8.15  [project net FSMC_D14]
PD10: P8.16  [project net FSMC_D15]
PD11: P8.17  [project net FSMC_A16]
PD12: P8.18  [project net FSMC_A17]
PD13: P8.19  [project net FSMC_A18]
PD14: P8.20  [project net FSMC_D0]
PD15: P8.21  [project net FSMC_D1]
PE0: P7.55  [project net FSMC_ANBL0]
PE1: P7.56  [project net FSMC_ANBL1]
PE2: P7.44
PE3: P7.41
PE4: P7.42  [project net DCMI_D4]
PE5: P7.39  [project net DCMI_D6]
PE6: P7.40  [project net DCMI_D7]
PE7: P8.50  [project net FSMC_D4]
PE8: P8.47  [project net FSMC_D5]
PE9: P8.48  [project net FSMC_D6]
PE10: P8.45  [project net FSMC_D7]
PE11: P8.46  [project net FSMC_D8]
PE12: P8.44  [project net FSMC_D9]
PE13: P8.43  [project net FSMC_D10]
PE14: P8.42  [project net FSMC_D11]
PE15: P8.41  [project net FSMC_D12]
PF0: P7.31  [project net FSMC_A0]
PF1: P7.32  [project net FSMC_A1]
PF2: P7.29  [project net FSMC_A2]
PF3: P7.30  [project net FSMC_A3]
PF4: P7.27  [project net FSMC_A4]
PF5: P7.28  [project net A5]
PF6: P7.25
PF7: P7.26
PF8: P7.23
PF9: P7.24  [project net LCD_BK]
PF10: P7.21  [project net DCMI_RESET]
PF11: P7.14  [project net LCD_RST]
PF13: P8.53  [project net A7]
PF14: P8.54  [project net A8]
PF15: P8.51  [project net A9]
PG0: P8.52  [project net FSMC_A10]
PG1: P8.49  [project net FSMC_A11]
PG2: P8.22  [project net FSMC_A12]
PG3: P8.23  [project net FSMC_A13]
PG4: P8.24  [project net FSMC_A14]
PG5: P8.25  [project net FSMC_A15]
PG6: P8.26
PG7: P8.27
PG8: P8.28
PG9: P7.63
PG10: P7.64  [project net FSMC_NE3]
PG11: P7.43
PG12: P7.45
PG13: P7.46
PG14: P7.47
PG15: P7.69
PH2: P7.16
PH3: P7.13
PH4: P7.9
PH5: P7.10
PH6: P8.3
PH7: P8.4
PH8: P8.5
PH9: P8.6
PH10: P8.7
PH11: P8.8
PH12: P8.9
PH13: P8.61
PH14: P8.64
PH15: P8.63
PI0: P8.66
PI1: P8.65
PI2: P8.68
PI3: P8.67
PI4: P7.68
PI5: P7.67
PI6: P7.66
PI7: P7.65
PI8: P7.38
PI9: P7.36
PI10: P7.33
PI11: P7.34
VBAT: P7.37
NetD2_2: D2.2(K) R23.1
NetD3_2: D3.2(K) R24.1
NetD4_2: D4.2(K) R25.1

### Library data of the parts
D2-D4 = LED0: Typical INFRARED GaAs LED; Published: 8-Jun-2000; LatestRevisionDate: 08-Jul-2005; LatestRevisionNote: Mech Layer 1 removed.; PackageReference: LED-0; Publisher: Altium Limited; PackageDescription: LED; 2 Leads
R23-R25 = Res1: Resistor; Published: 8-Jun-2000; LatestRevisionDate: 17-Jul-2002; LatestRevisionNote: Re-released for DXP Platform.; PackageReference: AXIAL-0.3; Publisher: Altium Limited; PackageDescription: Axial Device, Thru-Hole; 2 Leads; 0.3 in Pin Spacing; Value: 1K

## Nets that join several sheets
3V3: Sheet2 (36 pins), Sheet1 (19 pins)
3V3_MCU: Sheet2 (P1.1 R1.2 S2.1 U3.1), Sheet1 (10 pins), Sheet3 (D2.1 D3.1 D4.1 P8.2)
5V_USB: Sheet2 (*1.2 *1.11 F1.1), Sheet1 (6 pins), Sheet3 (P8.69)
GND: Sheet2 (54 pins), Sheet1 (36 pins), Sheet3 (P7.70 P8.1 P8.70 R23.2)
VREF: Sheet2 (P1.3), Sheet3 (P7.2)
A5: Sheet1 (U1.21 U4.18), Sheet3 (P7.28)
A7: Sheet1 (U1.63 U4.20), Sheet3 (P8.53)
A8: Sheet1 (U1.64 U4.21), Sheet3 (P8.54)
A9: Sheet1 (U1.65 U4.22), Sheet3 (P8.51)
BOOT0: Sheet2 (R2.2 S3.2 U1.166), Sheet1 (R22.1)
CH340_RXD: Sheet2 (U1.120), Sheet1 (P6.2), Sheet3 (P8.34)
CH340_TXD: Sheet2 (U1.121), Sheet1 (P6.4), Sheet3 (P8.35)
DCAI_VSYNC: Sheet2 (U1.165), Sheet1 (P4.14), Sheet3 (P7.52)
DCAM_PCLK: Sheet2 (U1.52), Sheet1 (P4.3), Sheet3 (P7.6)
DCMI_D0: Sheet2 (U1.115), Sheet1 (P4.7), Sheet3 (P8.29)
DCMI_D1: Sheet2 (U1.116), Sheet1 (P4.5), Sheet3 (P8.30)
DCMI_D2: Sheet2 (U1.117), Sheet1 (P4.4 R16.1 U8.7), Sheet3 (P8.31)
DCMI_D3: Sheet2 (U1.118), Sheet1 (P4.6 R15.1 U8.8), Sheet3 (P8.32)
DCMI_D4: Sheet1 (P4.8 U1.3), Sheet3 (P7.42)
DCMI_D5: Sheet2 (U1.163), Sheet1 (P4.9 U5.5), Sheet3 (P7.50)
DCMI_D6: Sheet1 (P4.10 U1.4), Sheet3 (P7.39)
DCMI_D7: Sheet1 (P4.11 U1.5), Sheet3 (P7.40)
DCMI_HREF: Sheet2 (U1.50), Sheet1 (P4.12), Sheet3 (P7.8)
DCMI_PWDN: Sheet2 (U1.32), Sheet1 (P4.13)
DCMI_RESET: Sheet1 (P4.15 U1.28), Sheet3 (P7.21)
DCMI_SCL: Sheet2 (U1.167), Sheet1 (P4.16), Sheet3 (P7.53)
DCMI_SDA: Sheet2 (U1.168), Sheet1 (P4.17 R12.1 U6.6), Sheet3 (P7.54)
DCMI_XCLK: Sheet2 (U1.119), Sheet1 (P4.2), Sheet3 (P8.33)
FSMC_A0: Sheet1 (P3.10 U1.16 U4.1), Sheet3 (P7.31)
FSMC_A1: Sheet1 (U1.17 U4.2), Sheet3 (P7.32)
FSMC_A2: Sheet1 (U1.18 U4.3), Sheet3 (P7.29)
FSMC_A3: Sheet1 (U1.19 U4.4), Sheet3 (P7.30)
FSMC_A4: Sheet1 (U1.20 U4.5), Sheet3 (P7.27)
FSMC_A10: Sheet1 (U1.66 U4.23), Sheet3 (P8.52)
FSMC_A11: Sheet1 (U1.67 U4.24), Sheet3 (P8.49)
FSMC_A12: Sheet1 (U1.106 U4.25), Sheet3 (P8.22)
FSMC_A13: Sheet1 (U1.107 U4.26), Sheet3 (P8.23)
FSMC_A14: Sheet1 (U1.108 U4.27), Sheet3 (P8.24)
FSMC_A15: Sheet1 (U1.109 U4.42), Sheet3 (P8.25)
FSMC_A16: Sheet1 (U1.99 U4.43), Sheet3 (P8.17)
FSMC_A17: Sheet1 (U1.100 U4.44), Sheet3 (P8.18)
FSMC_A18: Sheet1 (U1.101 U4.28), Sheet3 (P8.19)
FSMC_ANBL0: Sheet1 (U1.169), Sheet3 (P7.55)
FSMC_ANBL1: Sheet1 (U1.170), Sheet3 (P7.56)
FSMC_D0: Sheet1 (P3.17 U1.104 U4.7), Sheet3 (P8.20)
FSMC_D1: Sheet1 (P3.18 U1.105 U4.8), Sheet3 (P8.21)
FSMC_D2: Sheet1 (P3.19 U1.142 U4.9), Sheet3 (P8.59)
FSMC_D3: Sheet1 (P3.20 U1.143 U4.10), Sheet3 (P8.62)
FSMC_D4: Sheet1 (P3.21 U1.68 U4.13), Sheet3 (P8.50)
FSMC_D5: Sheet1 (P3.22 U1.69 U4.14), Sheet3 (P8.47)
FSMC_D6: Sheet1 (P3.23 U1.70 U4.15), Sheet3 (P8.48)
FSMC_D7: Sheet1 (P3.24 U1.73 U4.16), Sheet3 (P8.45)
FSMC_D8: Sheet1 (P3.25 U1.74 U4.29), Sheet3 (P8.46)
FSMC_D9: Sheet1 (P3.26 U1.75 U4.30), Sheet3 (P8.44)
FSMC_D10: Sheet1 (P3.27 U1.76 U4.31), Sheet3 (P8.43)
FSMC_D11: Sheet1 (P3.28 U1.77 U4.32), Sheet3 (P8.42)
FSMC_D12: Sheet1 (P3.29 U1.78 U4.35), Sheet3 (P8.41)
FSMC_D13: Sheet1 (P3.30 U1.96 U4.36), Sheet3 (P8.10)
FSMC_D14: Sheet1 (P3.31 U1.97 U4.37), Sheet3 (P8.15)
FSMC_D15: Sheet1 (P3.32 U1.98 U4.38), Sheet3 (P8.16)
FSMC_NE3: Sheet1 (P3.9 U1.153), Sheet3 (P7.64)
FSMC_NEW: Sheet1 (P3.11 U1.147 U4.17), Sheet3 (P7.60)
FSMC_NOR: Sheet1 (P3.12 U1.146 U4.41), Sheet3 (P7.59)
IIC_SDA: Sheet2 (U1.79), Sheet1 (R13.1 U6.5), Sheet3 (P8.40)
LCD_BK: Sheet1 (P3.33 U1.27), Sheet3 (P7.24)
LCD_RST: Sheet1 (P3.15 U1.59), Sheet3 (P7.14)
NRESET: Sheet2 (C1.1 R1.1 S1.1 U1.31), Sheet1 (D1.1)
PA0: Sheet2 (S2.2 U1.40), Sheet3 (P7.17)
PA1: Sheet2 (U1.41), Sheet3 (P7.18)
PA2: Sheet2 (U1.42), Sheet3 (P7.15)
PA3: Sheet2 (U1.47), Sheet3 (P7.7)
PA5: Sheet2 (U1.51), Sheet3 (P7.5)
PA7: Sheet2 (U1.53), Sheet3 (P7.3)
PA11: Sheet2 (U1.122), Sheet3 (P8.36)
PA12: Sheet2 (U1.123), Sheet3 (P8.37)
PA13: Sheet2 (P2.2 U1.124), Sheet3 (P8.38)
PA14: Sheet2 (P2.3 U1.137), Sheet3 (P8.56)
PA15: Sheet2 (U1.138), Sheet3 (P8.55)
PB0: Sheet2 (U1.56), Sheet3 (P7.12)
PB1: Sheet2 (U1.57), Sheet3 (P7.11)
PB3: Sheet2 (U1.161), Sheet1 (U5.6), Sheet3 (P7.48)
PB4: Sheet2 (U1.162), Sheet1 (U5.2), Sheet3 (P7.49)
PB6: Sheet2 (U1.164), Sheet3 (P7.51)
PB11: Sheet2 (U1.80), Sheet3 (P8.39)
PB12: Sheet2 (U1.92), Sheet3 (P8.11)
PB13: Sheet2 (U1.93), Sheet3 (P8.12)
PB14: Sheet2 (U1.94), Sheet3 (P8.13)
PB15: Sheet2 (U1.95), Sheet3 (P8.14)
PC1: Sheet2 (U1.33), Sheet3 (P7.22)
PC2: Sheet2 (U1.34), Sheet3 (P7.19)
PC3: Sheet2 (U1.35), Sheet3 (P7.20)
PC4: Sheet2 (U1.54), Sheet3 (P7.4 R24.2)
PC5: Sheet2 (U1.55), Sheet3 (P7.1 R25.2)
PC10: Sheet2 (U1.139), Sheet1 (R19.1 U8.1), Sheet3 (P8.58)
PC11: Sheet2 (U1.140), Sheet1 (R18.1 U8.2), Sheet3 (P8.57)
PC12: Sheet2 (U1.141), Sheet1 (U8.5), Sheet3 (P8.60)
PC13: Sheet2 (U1.8), Sheet3 (P7.35)
PD2: Sheet1 (R17.1 U1.144 U8.3), Sheet3 (P7.57)
PD3: Sheet1 (P3.4 U1.145), Sheet3 (P7.58)
PD6: Sheet1 (P3.3 U1.150), Sheet3 (P7.61)
PD7: Sheet1 (P3.2 U1.151), Sheet3 (P7.62)
PE2: Sheet1 (U1.1), Sheet3 (P7.44)
PE3: Sheet1 (U1.2), Sheet3 (P7.41)
PF6: Sheet1 (U1.24), Sheet3 (P7.25)
PF7: Sheet1 (U1.25), Sheet3 (P7.26)
PF8: Sheet1 (U1.26), Sheet3 (P7.23)
PG6: Sheet1 (U1.110 U5.1), Sheet3 (P8.26)
PG7: Sheet1 (U1.111), Sheet3 (P8.27)
PG8: Sheet1 (P3.5 U1.112), Sheet3 (P8.28)
PG9: Sheet1 (P3.1 U1.152), Sheet3 (P7.63)
PG11: Sheet1 (U1.154), Sheet3 (P7.43)
PG12: Sheet1 (U1.155), Sheet3 (P7.45)
PG13: Sheet1 (U1.156), Sheet3 (P7.46)
PG14: Sheet1 (U1.157), Sheet3 (P7.47)
PG15: Sheet1 (U1.160), Sheet3 (P7.69)
PH2: Sheet2 (U1.43), Sheet3 (P7.16)
PH3: Sheet2 (U1.44), Sheet3 (P7.13)
PH4: Sheet2 (U1.45), Sheet3 (P7.9)
PH5: Sheet2 (U1.46), Sheet3 (P7.10)
PH6: Sheet2 (U1.83), Sheet3 (P8.3)
PH7: Sheet2 (U1.84), Sheet3 (P8.4)
PH8: Sheet2 (U1.85), Sheet3 (P8.5)
PH9: Sheet2 (U1.86), Sheet3 (P8.6)
PH10: Sheet2 (U1.87), Sheet3 (P8.7)
PH11: Sheet2 (U1.88), Sheet3 (P8.8)
PH12: Sheet2 (U1.89), Sheet3 (P8.9)
PH13: Sheet2 (U1.128), Sheet3 (P8.61)
PH14: Sheet2 (U1.129), Sheet3 (P8.64)
PH15: Sheet2 (U1.130), Sheet3 (P8.63)
PI0: Sheet2 (U1.131), Sheet3 (P8.66)
PI1: Sheet2 (U1.132), Sheet3 (P8.65)
PI2: Sheet2 (U1.133), Sheet3 (P8.68)
PI3: Sheet2 (U1.134), Sheet3 (P8.67)
PI4: Sheet2 (U1.173), Sheet3 (P7.68)
PI5: Sheet2 (U1.174), Sheet3 (P7.67)
PI6: Sheet2 (U1.175), Sheet3 (P7.66)
PI7: Sheet2 (U1.176), Sheet3 (P7.65)
PI8: Sheet2 (U1.7), Sheet3 (P7.38)
PI9: Sheet2 (U1.11), Sheet3 (P7.36)
PI10: Sheet2 (U1.12), Sheet3 (P7.33)
PI11: Sheet2 (U1.13), Sheet3 (P7.34)
VBAT: Sheet2 (U1.6 U3.3), Sheet3 (P7.37)